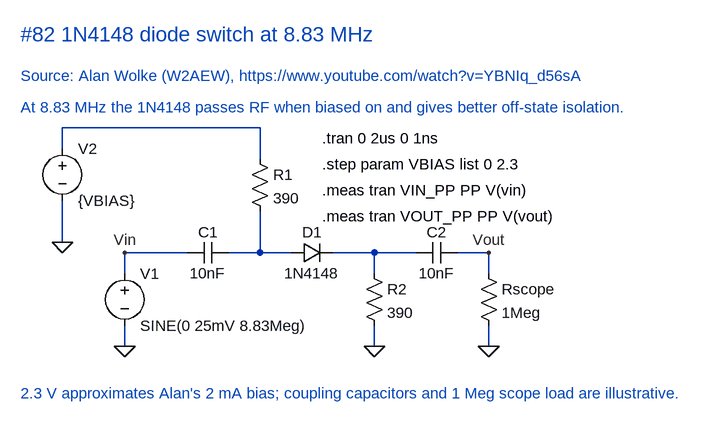
[diagram p0: schematic 1N4148 8.83 MHz comparison.asc]
1N4148 8.83 MHz comparison.asc, the LTspice schematic file:
Version 4.1
SHEET 1 1020 680
WIRE 336 -224 32 -224
WIRE 32 -192 32 -224
WIRE 336 -176 336 -224
WIRE 32 -80 32 -112
WIRE 224 -32 128 -32
WIRE 336 -32 336 -96
WIRE 336 -32 288 -32
WIRE 384 -32 336 -32
WIRE 512 -32 448 -32
WIRE 576 -32 512 -32
WIRE 688 -32 640 -32
WIRE 688 0 688 -32
WIRE 688 112 688 80
WIRE 128 0 128 -32
WIRE 512 0 512 -32
WIRE 128 112 128 80
WIRE 512 112 512 80
FLAG 128 112 0
WIRE 32 -48 32 -80
FLAG 32 -48 0
FLAG 512 112 0
FLAG 688 -32 Vout
FLAG 688 112 0
FLAG 128 -32 Vin
SYMBOL voltage 128 -16 R0
WINDOW 123 0 0 Left 0
WINDOW 39 0 0 Left 0
SYMATTR InstName V1
SYMATTR Value SINE(0 25mV 8.83Meg)
SYMBOL diode 384 -16 R270
WINDOW 0 32 32 VTop 2
WINDOW 3 0 32 VBottom 2
SYMATTR InstName D1
SYMATTR Value 1N4148
SYMBOL cap 288 -48 R90
WINDOW 0 0 32 VBottom 2
WINDOW 3 32 32 VTop 2
SYMATTR InstName C1
SYMATTR Value 10nF
SYMBOL res 320 -192 R0
SYMATTR InstName R1
SYMATTR Value 390
SYMBOL voltage 32 -208 R0
WINDOW 123 0 0 Left 0
WINDOW 39 0 0 Left 0
SYMATTR InstName V2
SYMATTR Value {VBIAS}
SYMBOL res 496 -16 R0
SYMATTR InstName R2
SYMATTR Value 390
SYMBOL cap 640 -48 R90
WINDOW 0 0 32 VBottom 2
WINDOW 3 32 32 VTop 2
SYMATTR InstName C2
SYMATTR Value 10nF
SYMBOL res 672 -16 R0
SYMATTR InstName Rscope
SYMATTR Value 1Meg
TEXT 432 -208 Left 2 !.tran 0 2us 0 1ns
TEXT 432 -168 Left 2 !.step param VBIAS list 0 2.3
TEXT 432 -128 Left 2 !.meas tran VIN_PP PP V(vin)
TEXT 432 -88 Left 2 !.meas tran VOUT_PP PP V(vout)
TEXT -32 -368 Left 3 ;#82 1N4148 diode switch at 8.83 MHz
TEXT -32 -304 Left 2 ;Source: Alan Wolke (W2AEW), https://www.youtube.com/watch?v=YBNIq_d56sA
TEXT -32 -256 Left 2 ;At 8.83 MHz the 1N4148 passes RF when biased on and gives better off-state isolation.
TEXT -32 184 Left 2 ;2.3 V approximates Alan's 2 mA bias; coupling capacitors and 1 Meg scope load are illustrative.

The netlist it stands for:
* 1N4148 8.83 MHz comparison.asc
V1 Vin 0 SINE(0 25mV 8.83Meg)
D1 N002 N003 1N4148
C1 N002 Vin 10nF
R1 N001 N002 390
V2 N001 0 {VBIAS}
R2 N003 0 390
C2 Vout N003 10nF
Rscope Vout 0 1Meg
.model D D
.lib standard.dio
.tran 0 2us 0 1ns
.step param VBIAS list 0 2.3
.meas tran VIN_PP PP V(vin)
.meas tran VOUT_PP PP V(vout)
* #82 1N4148 diode switch at 8.83 MHz
* Source: Alan Wolke (W2AEW), https://www.youtube.com/watch?v=YBNIq_d56sA
* At 8.83 MHz the 1N4148 passes RF when biased on and gives better off-state isolation.
* 2.3 V approximates Alan's 2 mA bias; coupling capacitors and 1 Meg scope load are illustrative.
.backanno
.end